# Altium schematic sheet sEMG-Sensor-Sheet.SchDoc
size A4; SheetNumber: 5; SheetTotal: 12
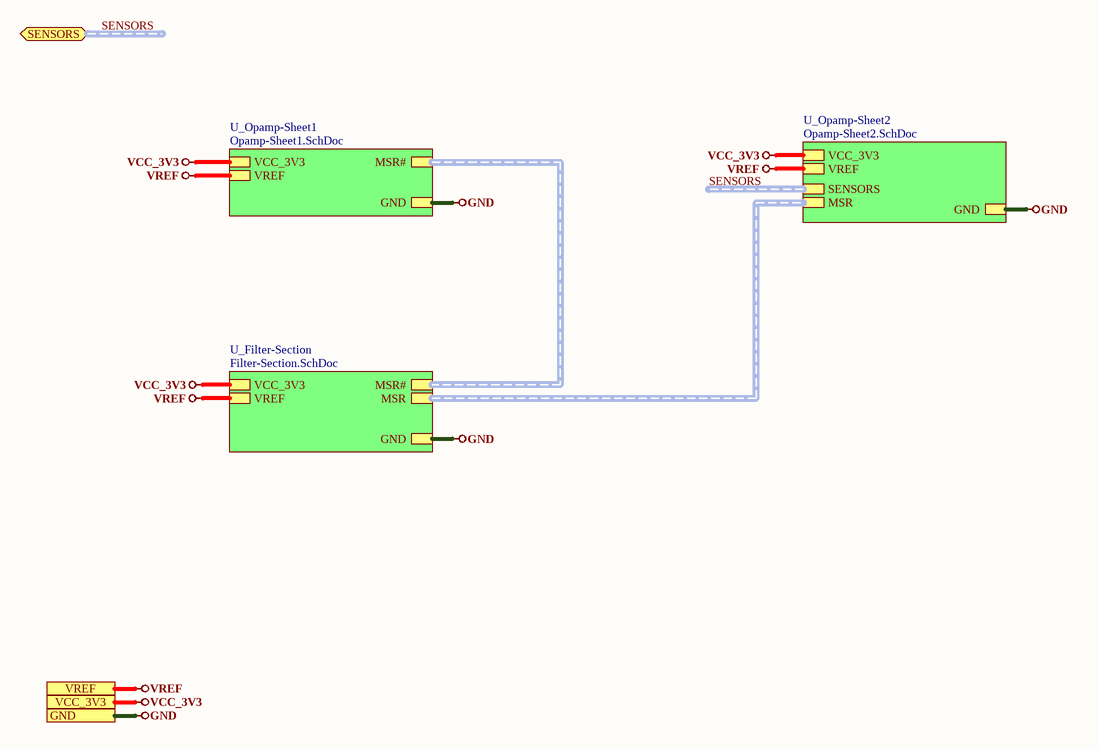
[diagram p0: sEMG-Sensor-Sheet.SchDoc]

## Sub-sheets
U_Filter-Section = Filter-Section.SchDoc: MSR (harness MSR), MSR# (harness MSR#), VCC_3V3, GND, VREF
U_Opamp-Sheet1 = Opamp-Sheet1.SchDoc: VCC_3V3, GND, MSR# (harness MSR#), VREF
U_Opamp-Sheet2 = Opamp-Sheet2.SchDoc: SENSORS (harness SENSORS), MSR (harness MSR), VCC_3V3, GND, VREF

## Ports
GND, SENSORS (bidir, harness SENSORS), VCC_3V3, VREF

## Nets
GND: port GND, sheet U_Opamp-Sheet1/GND, sheet U_Opamp-Sheet2/GND, sheet U_Filter-Section/GND
VCC_3V3: port VCC_3V3, sheet U_Opamp-Sheet1/VCC_3V3, sheet U_Opamp-Sheet2/VCC_3V3, sheet U_Filter-Section/VCC_3V3
VREF: port VREF, sheet U_Opamp-Sheet1/VREF, sheet U_Opamp-Sheet2/VREF, sheet U_Filter-Section/VREF

## Buses and harness runs
harness SENSORS = port SENSORS
harness SENSORS = sheet U_Opamp-Sheet2/SENSORS
harness sheet U_Filter-Section/MSR = sheet U_Opamp-Sheet2/MSR
harness sheet U_Filter-Section/MSR# = sheet U_Opamp-Sheet1/MSR#

## Notes on the sheet
- 1
- Huzaifa Ali